# Altium schematic sheet GPIOs.SchDoc
size A4; SheetNumber: 2; SheetTotal: 7; SPICEModelCacheMUUOBHTQ: <root> / <DocumentId>MUUOBHTQ</DocumentId> / </root>
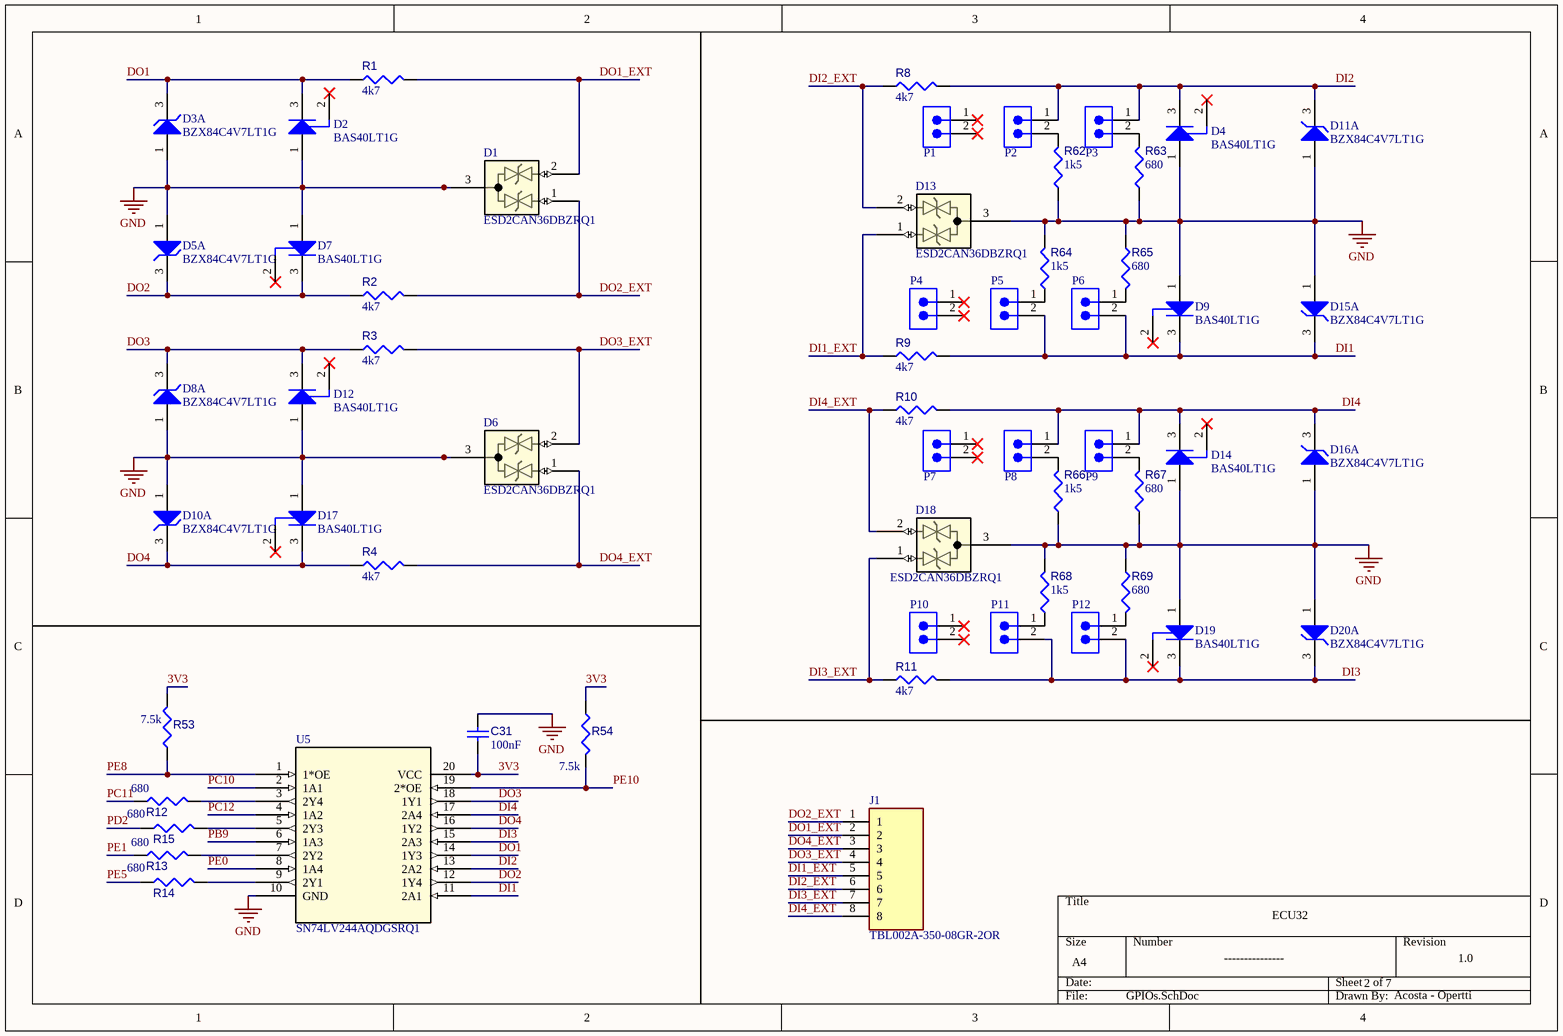
[diagram p0: GPIOs.SchDoc]

## Parts
C31  value 100nF  [Capacitor cerámico TH-Footprint-1]  (hidden comment: Capacitor cerámico TH)
D1  ESD2CAN36DBZRQ1  [SOT-23-3_DBZ_TEX]
D2  BAS40LT1G  [ONSC-SOT-23-3-318-08_V]
D3  BZX84C4V7LT1G  [ONSC-SOT-23-3-318-08_V]  (part A of 2)
D4  BAS40LT1G  [ONSC-SOT-23-3-318-08_V]
D5  BZX84C4V7LT1G  [ONSC-SOT-23-3-318-08_V]  (part A of 2)
D6  ESD2CAN36DBZRQ1  [SOT-23-3_DBZ_TEX]
D7  BAS40LT1G  [ONSC-SOT-23-3-318-08_V]
D8  BZX84C4V7LT1G  [ONSC-SOT-23-3-318-08_V]  (part A of 2)
D9  BAS40LT1G  [ONSC-SOT-23-3-318-08_V]
D10  BZX84C4V7LT1G  [ONSC-SOT-23-3-318-08_V]  (part A of 2)
D11  BZX84C4V7LT1G  [ONSC-SOT-23-3-318-08_V]  (part A of 2)
D12  BAS40LT1G  [ONSC-SOT-23-3-318-08_V]
D13  ESD2CAN36DBZRQ1  [SOT-23-3_DBZ_TEX]
D14  BAS40LT1G  [ONSC-SOT-23-3-318-08_V]
D15  BZX84C4V7LT1G  [ONSC-SOT-23-3-318-08_V]  (part A of 2)
D16  BZX84C4V7LT1G  [ONSC-SOT-23-3-318-08_V]  (part A of 2)
D17  BAS40LT1G  [ONSC-SOT-23-3-318-08_V]
D18  ESD2CAN36DBZRQ1  [SOT-23-3_DBZ_TEX]
D19  BAS40LT1G  [ONSC-SOT-23-3-318-08_V]
D20  BZX84C4V7LT1G  [ONSC-SOT-23-3-318-08_V]  (part A of 2)
J1  TBL002A-350-08GR-2OR  [CUI_TBL002A-350-08GR-2OR]
P1  TSW-102-26-F-S  [SMTC-TSW-102-26-XX-S]  (value not drawn)
P2  TSW-102-26-F-S  [SMTC-TSW-102-26-XX-S]  (value not drawn)
P3  TSW-102-26-F-S  [SMTC-TSW-102-26-XX-S]  (value not drawn)
P4  TSW-102-26-F-S  [SMTC-TSW-102-26-XX-S]  (value not drawn)
P5  TSW-102-26-F-S  [SMTC-TSW-102-26-XX-S]  (value not drawn)
P6  TSW-102-26-F-S  [SMTC-TSW-102-26-XX-S]  (value not drawn)
P7  TSW-102-26-F-S  [SMTC-TSW-102-26-XX-S]  (value not drawn)
P8  TSW-102-26-F-S  [SMTC-TSW-102-26-XX-S]  (value not drawn)
P9  TSW-102-26-F-S  [SMTC-TSW-102-26-XX-S]  (value not drawn)
P10  TSW-102-26-F-S  [SMTC-TSW-102-26-XX-S]  (value not drawn)
P11  TSW-102-26-F-S  [SMTC-TSW-102-26-XX-S]  (value not drawn)
P12  TSW-102-26-F-S  [SMTC-TSW-102-26-XX-S]  (value not drawn)
R1  value 4k7  [RESA60-630X240]  (hidden comment: MFR-25FBF52-47R5)
R2  value 4k7  [RESA60-630X240]  (hidden comment: MFR-25FBF52-47R5)
R3  value 4k7  [RESA60-630X240]  (hidden comment: MFR-25FBF52-47R5)
R4  value 4k7  [RESA60-630X240]  (hidden comment: MFR-25FBF52-47R5)
R8  value 4k7  [RESA60-630X240]  (hidden comment: MFR-25FBF52-47R5)
R9  value 4k7  [RESA60-630X240]  (hidden comment: MFR-25FBF52-47R5)
R10  value 4k7  [RESA60-630X240]  (hidden comment: MFR-25FBF52-47R5)
R11  value 4k7  [RESA60-630X240]  (hidden comment: MFR-25FBF52-47R5)
R12  value 680  [RESA60-630X240]  (hidden comment: MFR-25FBF52-47R5)
R13  value 680  [RESA60-630X240]  (hidden comment: MFR-25FBF52-47R5)
R14  value 680  [RESA60-630X240]  (hidden comment: MFR-25FBF52-47R5)
R15  value 680  [RESA60-630X240]  (hidden comment: MFR-25FBF52-47R5)
R53  value 7.5k  [RESA60-630X240]  (hidden comment: MFR-25FBF52-47R5)
R54  value 7.5k  [RESA60-630X240]  (hidden comment: MFR-25FBF52-47R5)
R62  value 1k5  [RESA60-630X240]  (hidden comment: MFR-25FBF52-47R5)
R63  value 680  [RESA60-630X240]  (hidden comment: MFR-25FBF52-47R5)
R64  value 1k5  [RESA60-630X240]  (hidden comment: MFR-25FBF52-47R5)
R65  value 680  [RESA60-630X240]  (hidden comment: MFR-25FBF52-47R5)
R66  value 1k5  [RESA60-630X240]  (hidden comment: MFR-25FBF52-47R5)
R67  value 680  [RESA60-630X240]  (hidden comment: MFR-25FBF52-47R5)
R68  value 1k5  [RESA60-630X240]  (hidden comment: MFR-25FBF52-47R5)
R69  value 680  [RESA60-630X240]  (hidden comment: MFR-25FBF52-47R5)
U5  SN74LV244AQDGSRQ1  [VSSOP20_DGS_TEX]

## Nets
GND: C31.2 D1.3(GND) D2.1(A) D3.1(A) D4.1(A) D5.1(A) D6.3(GND) D7.1(A) D8.1(A) D9.1(A) D10.1(A) D11.1(A) D12.1(A) D13.3(GND) D14.1(A) D15.1(A) D16.1(A) D17.1(A) D18.3(GND) D19.1(A) D20.1(A) R62.2 R63.2 R64.1 R65.2 R66.2 R67.2 R68.1 R69.2 U5.10(GND)
3V3: C31.1 R53.2 R54.2 U5.20(VCC)
DI1: D9.3(K) D15.3(K) P5.2 P6.2 R9.1 U5.11(2A1)
DI1_EXT: D13.1(IO) J1.5 R9.2
DI2: D4.3(K) D11.3(K) P2.1 P3.1 R8.1 U5.13(2A2)
DI2_EXT: D13.2(IO) J1.6 R8.2
DI3: D19.3(K) D20.3(K) P11.2 P12.2 R11.1 U5.15(2A3)
DI3_EXT: D18.1(IO) J1.7 R11.2
DI4: D14.3(K) D16.3(K) P8.1 P9.1 R10.1 U5.17(2A4)
DI4_EXT: D18.2(IO) J1.8 R10.2
DO1: D2.3(K) D3.3(K) R1.1 U5.14(1Y3)
DO1_EXT: D1.2(IO) J1.2 R1.2
DO2: D5.3(K) D7.3(K) R2.1 U5.12(1Y4)
DO2_EXT: D1.1(IO) J1.1 R2.2
DO3: D8.3(K) D12.3(K) R3.1 U5.18(1Y1)
DO3_EXT: D6.2(IO) J1.4 R3.2
DO4: D10.3(K) D17.3(K) R4.1 U5.16(1Y2)
DO4_EXT: D6.1(IO) J1.3 R4.2
PB9: U5.6(1A3)
PC10: U5.2(1A1)
PC11: R12.2
PC12: U5.4(1A2)
PD2: R15.2
PE0: U5.8(1A4)
PE1: R13.2
PE5: R14.2
PE8: R53.1 U5.1(1*OE)
PE10: R54.1 U5.19(2*OE)
NetP2_2: P2.2 R62.1
NetP3_2: P3.2 R63.1
NetP5_1: P5.1 R64.2
NetP6_1: P6.1 R65.1
NetP8_2: P8.2 R66.1
NetP9_2: P9.2 R67.1
NetP11_1: P11.1 R68.2
NetP12_1: P12.1 R69.1
NetR12_1: R12.1 U5.3(2Y4)
NetR13_1: R13.1 U5.7(2Y2)
NetR14_1: R14.1 U5.9(2Y1)
NetR15_1: R15.1 U5.5(2Y3)

Not connected (* = marked no-connect by the designer): D2 2(NC)*; D4 2(NC)*; D7 2(NC)*; D9 2(NC)*; D12 2(NC)*; D14 2(NC)*; D17 2(NC)*; D19 2(NC)*; P1 1* 2*; P4 1* 2*; P7 1* 2*; P10 1* 2*

## Notes on the sheet
- ECU32
- ---------------
- 2
- 7
- 1.0
- Acosta - Opertti

## Library data of the parts
C31 = CMP-001-00083-4
D1 D6 D13 D18 = CMP-004-00031-1: Automotive, two-channel bidirectional 36V ESD protection diode 3-SOT-23 -55 to 150; Manufacturer_Name: Texas Instruments; Design Item ID: ESD2CAN36DBZRQ1; Copyright: Copyright (C) 2025 Ultra Librarian. All rights reserved.; Source: ESD2CAN36DBZRQ1.SchLib; Manufacturer_Part_Number: ESD2CAN36DBZRQ1; Type: Type; RefDes: RefDes
D2 D4 D7 D9 D12 D14 D17 D19 = CMP-1055-00540-1: Schottky Barrier Diode, 3-Pin SOT-23, Pb-Free, Tape and Reel; Manufacturer: On Semiconductor; Configuration: Single; ComponentLink3Description: Package Specification; ComponentLink1URL: http://www.onsemi.com/; ComponentLink2Description: Datasheet; PackageDescription: 3-Pin Small Outline Transistor, Body 2.92 x 1.3 mm, Pitch 0.95 mm; ComponentLink3URL: http://www.onsemi.cn/pub_link/Collateral/318-08.PDF; PartNumber: BAS40LT1G; DatasheetVersion: Rev. 10; Packing: Tape and Reel; PackageReference: SOT-23-3-318-08; ComponentLink1Description: Manufacturer URL; ComponentLink2URL: http://www.onsemi.cn/pub_link/Collateral/BAS40LT1-D.PDF; RoHS: TRUE; Mounting Technology: Surface Mount; PackageVersion: Rev. AP, 11/2009
D3 D5 D8 D10 D11 D15 D16 D20 = CMP-1060-01153-1: Zener Voltage Regulator, 225 mW, 3-Pin SOT-23, Pb-Free, Tape and Reel; Manufacturer: On Semiconductor; ComponentLink1URL: http://www.onsemi.com/; RoHS: Pb-Free; ComponentLink3Description: Package Specification; ComponentLink1Description: Manufacturer URL; PackageVersion: Rev. AP, 11/2009; Mounting Technology: Surface Mount; ComponentLink3URL: http://www.onsemi.cn/pub_link/Collateral/318-08.PDF; Packing: Tape and Reel; PartNumber: BZX84C4V7LT1G; ComponentLink2URL: http://www.onsemi.com/pub_link/Collateral/BZX84C2V4LT1-D.PDF; ComponentLink2Description: Datasheet; PackageDescription: 3-Pin Small Outline Transistor, Body 2.92 x 1.3 mm, Pitch 0.95 mm; DatasheetVersion: Rev. 17; PackageReference: SOT-23-3-318-08
J1 = CMP-002-00071-2: 1~24 Poles, Screwless, 45Â°, 3.50 Pitch, 24~20 (AWG), Terminal Block Connector; MF: Same Sky; Check_prices: https://www.snapeda.com/parts/TBL002A-350-08GR-2OR/Same+Sky/view-part/?ref=eda; Pins: 8; MP: TBL002A-350-08GR-2OR; Component Type: Standard; SnapEDA_Link: https://www.snapeda.com/parts/TBL002A-350-08GR-2OR/Same+Sky/view-part/?ref=snap; Design Item ID: TBL002A-350-08GR-2OR; Case/Package: None; Value: *; Source: TBL002A-350-08GR-2OR.SchLib
P1-P12 = CMP-1024-00329-1: 0.025" SQ Post Header, Through-hole, Vertical, -55 to 125 degC, 2.54 mm Pitch, 2-Pin, Male, RoHS; Manufacturer: Samtec; Pitch: 2.54 mm; PackageVersion: DM, 8/1988; ComponentLink2Description: Datasheet; PackageReference: TSW-102-26-XX-S; ComponentLink3URL: http://www.samtec.com/documents/webfiles/cpdf/TSW-XXX-XX-XXX-X-XX-XXX-MKT.pdf; ComponentLink2URL: http://www.samtec.com/documents/webfiles/pdf/TSW_TH.PDF; ComponentLink1Description: Manufacturer URL; DatasheetVersion: F-214; RoHS: True; ComponentLink3Description: Package Specification; PartNumber: TSW-102-26-F-S; Temperature Range: -55 to 125 degC; Orientation: Vertical; ComponentLink1URL: http://www.samtec.com; PackageDescription: .025[0.64] SQ. Post Terminal Strip Assembly; Mounting Technology: Through-hole
R1-R4 R8-R15 R53 R54 R62-R69 = CMP-009-00058-4: Axial Resistor, 47.5 Ohm, +/- 1%, 0.25 W, -55 to 155 degC, 2-Pin THD, RoHS, Bulk; Manufacturer: Yageo; Voltage Rating: 250V; Power: 250mW; Packaging: Bulk; Package Description: 2-Pin Axial Lead, Dia 2.4 mm, Body Length 6.3 mm; Package Reference: MFR-25; Case/Package: Axial; Tolerance: 1%; RoHS Compliant: True; Package Quantity: 200; Max Operating Temperature: 155°C; Manufacturer URL: http://www.yageo.com/; Datasheet URL: http://www.yageo.com/documents/recent/Yageo%20LR_MFR_2013.pdf; Min Operating Temperature: -55°C; Datasheet Version: Apr-13; Mounting Technology: TH
U5 = CMP-033-000000-1: Automotive eight-channel 2-V to 5.5-V buffers with tri-state outputs 20-VSSOP -40 to 125; Manufacturer_Name: Texas Instruments; Type: Logic; Design Item ID: SN74LV244AQDGSRQ1; RefDes: RefDes; Source: SN74LV244AQDGSRQ1.SchLib; Copyright: Copyright (C) 2025 Ultra Librarian. All rights reserved.; Manufacturer_Part_Number: SN74LV244AQDGSRQ1